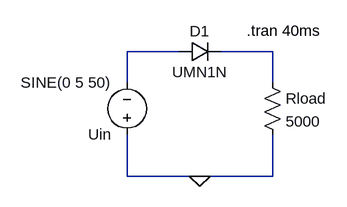
[diagram p0: schematic schema3.asc]
schema3.asc, the LTspice schematic file:
Version 4.1
SHEET 1 880 680
WIRE 192 80 112 80
WIRE 336 80 256 80
WIRE 112 128 112 80
WIRE 336 128 336 80
WIRE 112 272 112 208
WIRE 224 272 112 272
WIRE 336 272 336 208
WIRE 336 272 224 272
FLAG 224 272 0
SYMBOL diode 192 96 R270
WINDOW 0 32 32 VTop 2
WINDOW 3 0 32 VBottom 2
SYMATTR InstName D1
SYMATTR Value UMN1N
SYMBOL voltage 112 224 R180
WINDOW 123 0 0 Left 0
WINDOW 39 0 0 Left 0
SYMATTR InstName Uin
SYMATTR Value SINE(0 5 50)
SYMBOL res 320 112 R0
SYMATTR InstName Rload
SYMATTR Value 5000
TEXT 296 48 Left 2 !.tran 40ms

The netlist it stands for:
* schema3.asc
D1 N001 N002 UMN1N
V§Uin 0 N001 SINE(0 5 50)
Rload N002 0 5000
.model D D
.lib standard.dio
.tran 40ms
.backanno
.end